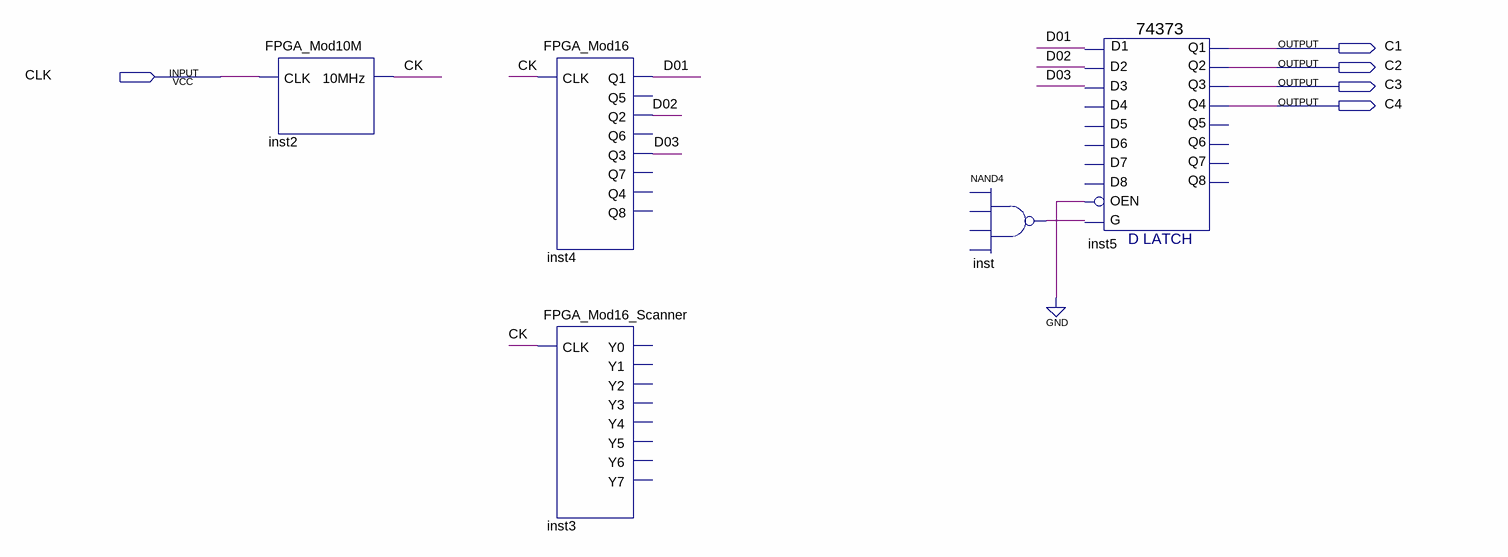
[diagram p0: schematic sheet]
// Quartus schematic FPGA_Key_Read_and_Latch.bdf as structural Verilog: 5 symbols, 5 pins
module FPGA_Key_Read_and_Latch (
  input  CLK,
  output C1,
  output C2,
  output C3,
  output C4
);

  wire CK, D01, D02, D03, inst_out;

  FPGA_Mod10M inst2 (.CLK(CLK), .\10MHz (CK));
  FPGA_Mod16 inst4 (.CLK(CK), .Q1(D01), .Q2(D02), .Q3(D03));  // open: Q5, Q6, Q7, Q4, Q8
  FPGA_Mod16_Scanner inst3 (.CLK(CK));  // open: Y0, Y1, Y2, Y3, Y4, Y5, Y6, Y7
  // NAND4 inst has open pins: IN1=open, IN2=open, IN3=open, IN4=open, OUT=inst_out
  \74373  inst5 (
    .D1(D01), .D3(D03), .D2(D02), .G(inst_out), .OEN(1'b0), .Q3(C3), .Q2(C2), .Q4(C4), .Q1(C1));  // open: D6, D7, D4, D5, D8, Q6, Q7, Q8, Q5
endmodule
